# EAGLE design mem3 (EAGLE 4.13)
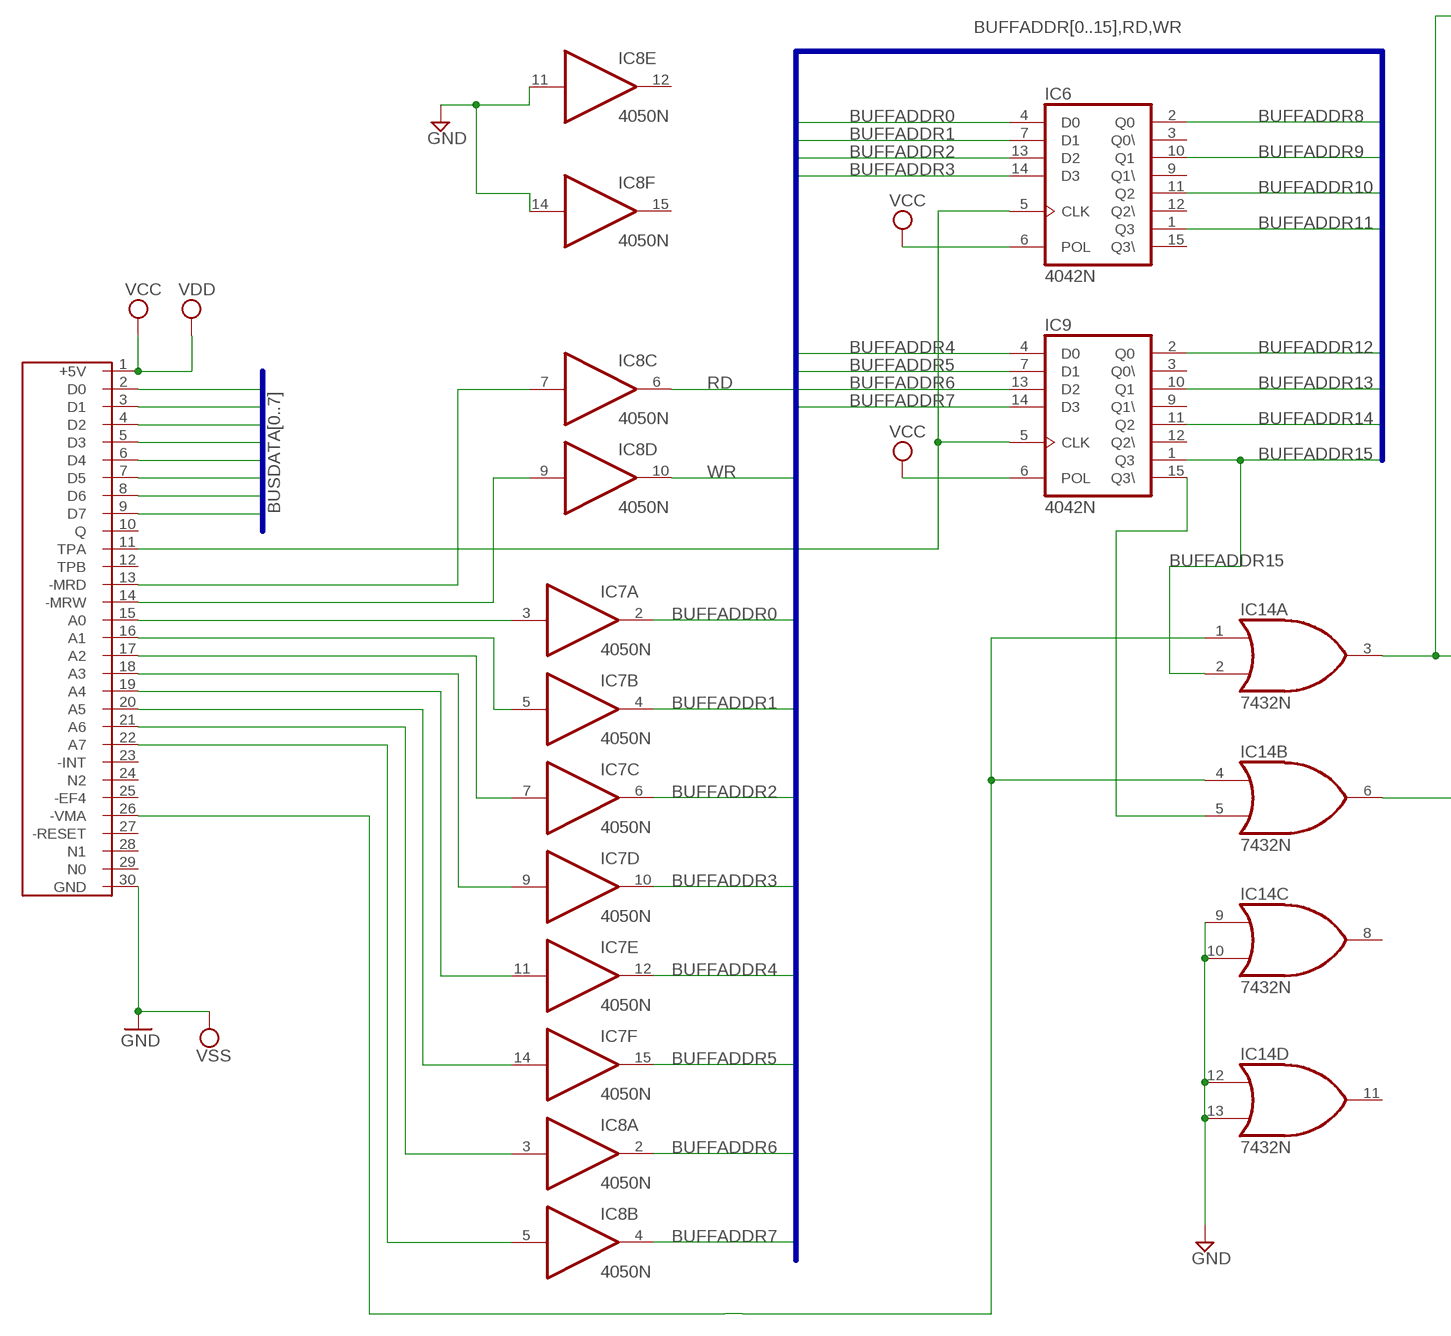
[diagram p0: schematic, sheet 1, part 1 of 2]
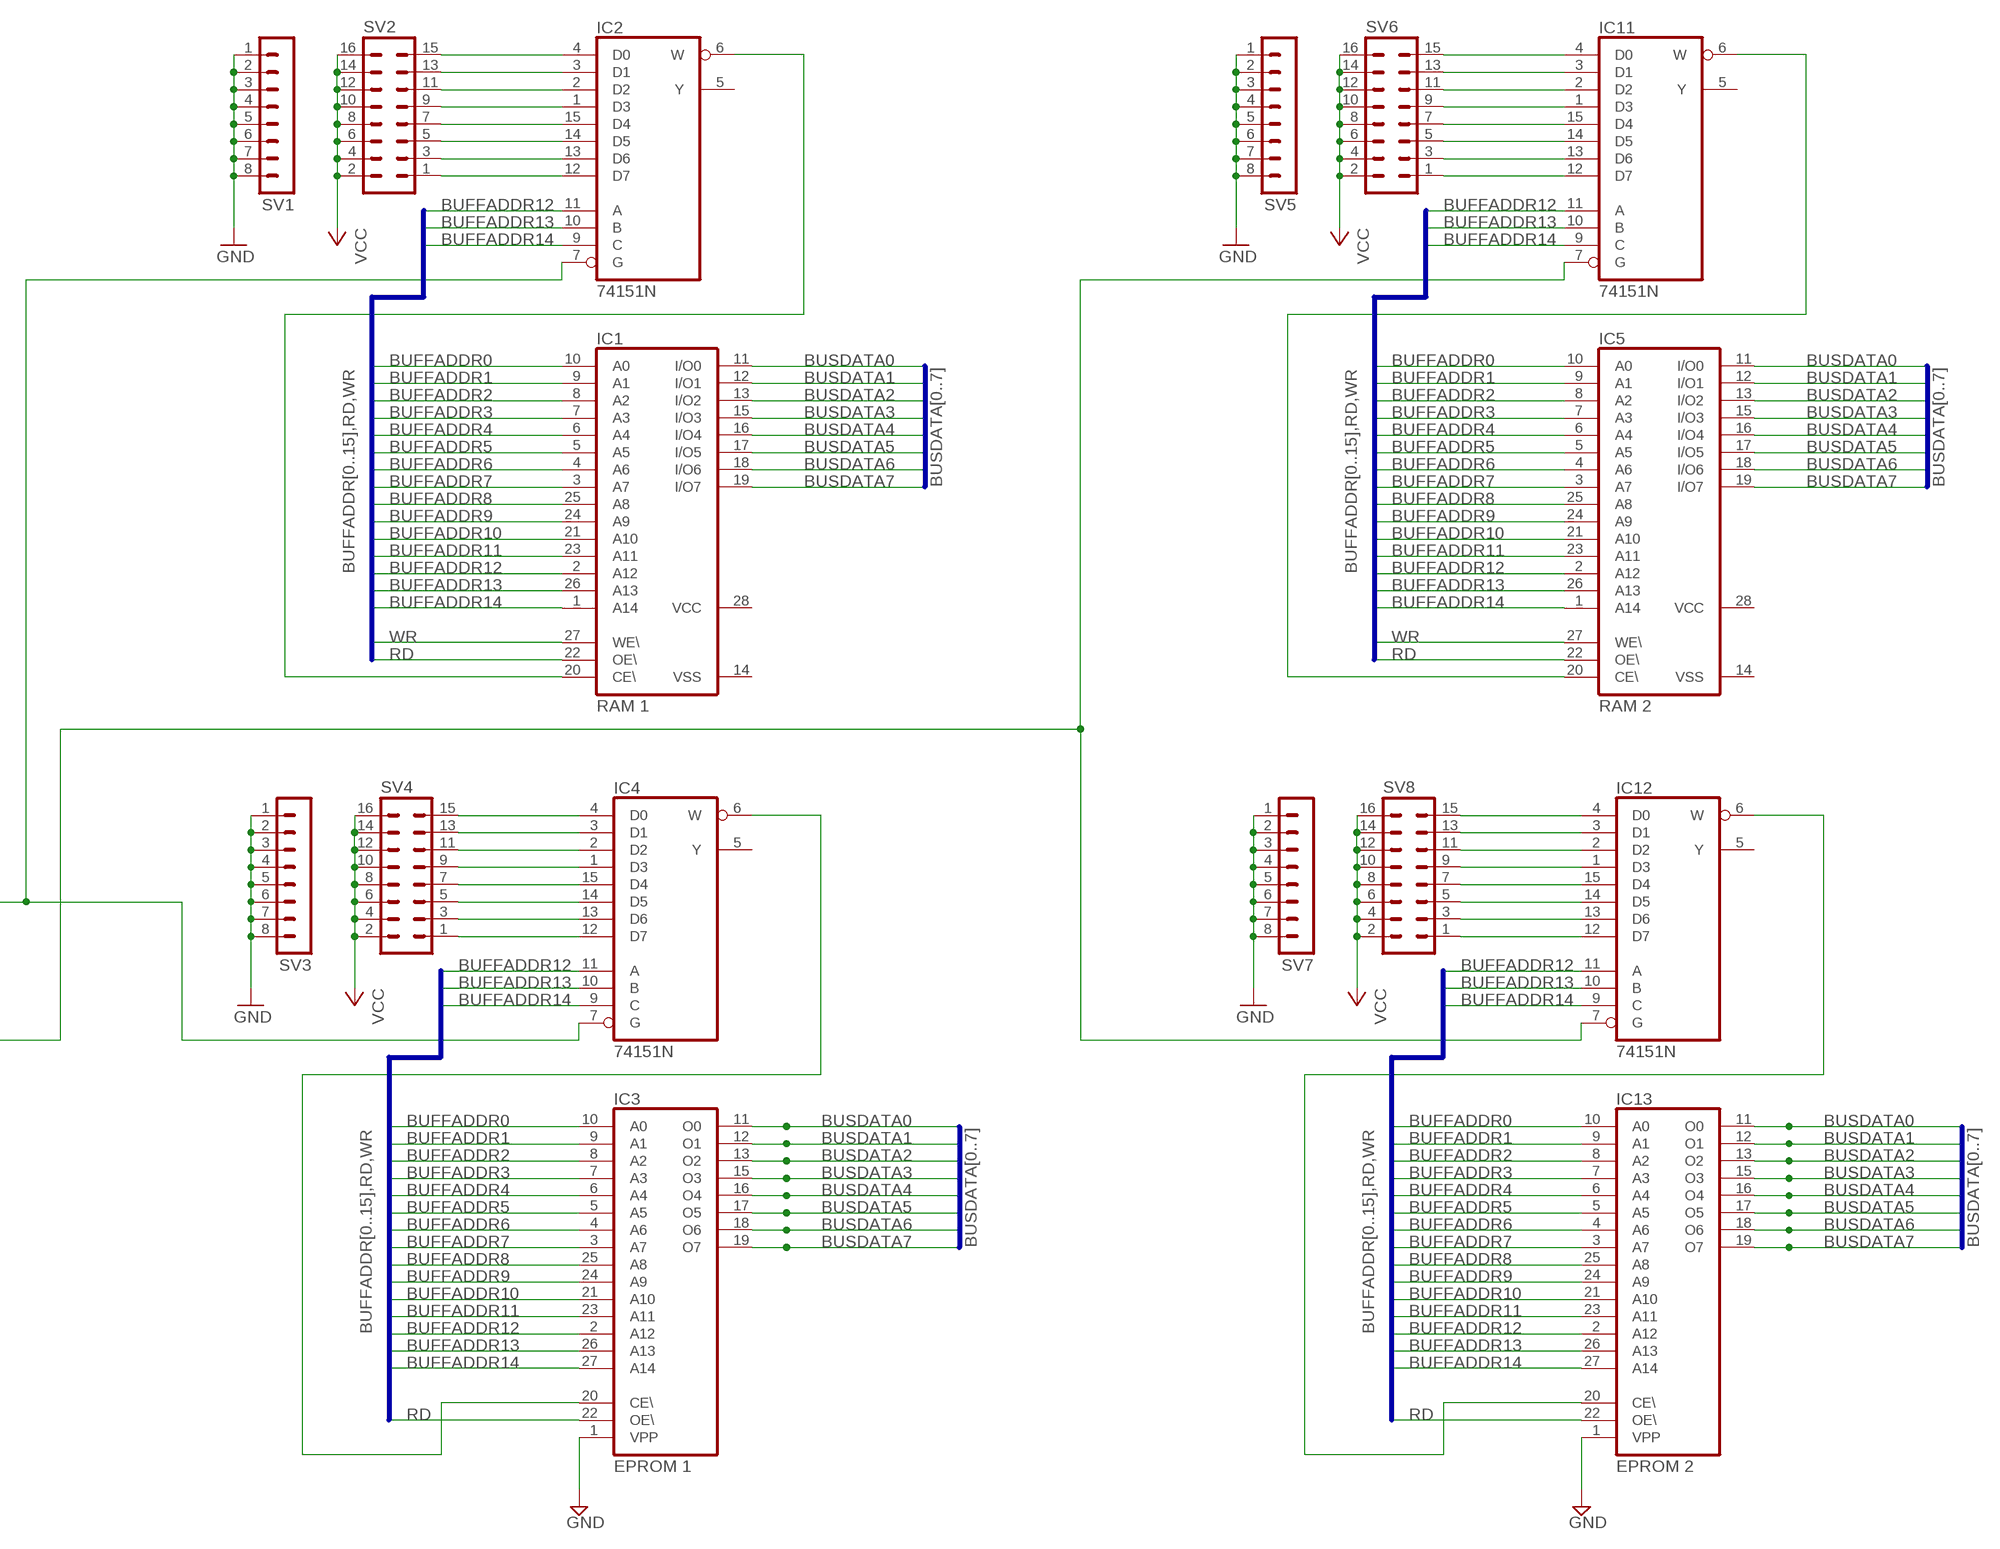
[diagram p1: schematic, sheet 1, part 2 of 2]

## Parts
IC1  RAM 1  58C256P  [DIL28-6]
IC2  74151N  [DIL16]
IC3  EPROM 1  27256  [DIL28]
IC4  74151N  [DIL16]
IC5  RAM 2  58C256P  [DIL28-6]
IC6  4042N  [DIL16]
IC7  4050N  [DIL16]
IC8  4050N  [DIL16]
IC9  4042N  [DIL16]
IC11  74151N  [DIL16]
IC12  74151N  [DIL16]
IC13  EPROM 2  27256  [DIL28]
IC14  7432N  [DIL14]
SV1  MA08-1  [MA08-1]
SV2  MA08-2  [MA08-2]
SV3  MA08-1  [MA08-1]
SV4  MA08-2  [MA08-2]
SV5  MA08-1  [MA08-1]
SV6  MA08-2  [MA08-2]
SV7  MA08-1  [MA08-1]
SV8  MA08-2  [MA08-2]
U$1  C30  [C30]

## Nets
BUFFADDR0: IC1.10(A0) IC3.10(A0) IC5.10(A0) IC6.4(D0) IC7.2(A:O) IC13.10(A0)
BUFFADDR1: IC1.9(A1) IC3.9(A1) IC5.9(A1) IC6.7(D1) IC7.4(B:O) IC13.9(A1)
BUFFADDR2: IC1.8(A2) IC3.8(A2) IC5.8(A2) IC6.13(D2) IC7.6(C:O) IC13.8(A2)
BUFFADDR3: IC1.7(A3) IC3.7(A3) IC5.7(A3) IC6.14(D3) IC7.10(D:O) IC13.7(A3)
BUFFADDR4: IC1.6(A4) IC3.6(A4) IC5.6(A4) IC7.12(E:O) IC9.4(D0) IC13.6(A4)
BUFFADDR5: IC1.5(A5) IC3.5(A5) IC5.5(A5) IC7.15(F:O) IC9.7(D1) IC13.5(A5)
BUFFADDR6: IC1.4(A6) IC3.4(A6) IC5.4(A6) IC8.2(A:O) IC9.13(D2) IC13.4(A6)
BUFFADDR7: IC1.3(A7) IC3.3(A7) IC5.3(A7) IC8.4(B:O) IC9.14(D3) IC13.3(A7)
BUFFADDR8: IC1.25(A8) IC3.25(A8) IC5.25(A8) IC6.2(Q0) IC13.25(A8)
BUFFADDR9: IC1.24(A9) IC3.24(A9) IC5.24(A9) IC6.10(Q1) IC13.24(A9)
BUFFADDR10: IC1.21(A10) IC3.21(A10) IC5.21(A10) IC6.11(Q2) IC13.21(A10)
BUFFADDR11: IC1.23(A11) IC3.23(A11) IC5.23(A11) IC6.1(Q3) IC13.23(A11)
BUFFADDR12: IC1.2(A12) IC2.11(A) IC3.2(A12) IC4.11(A) IC5.2(A12) IC9.2(Q0) IC11.11(A) IC12.11(A) IC13.2(A12)
BUFFADDR13: IC1.26(A13) IC2.10(B) IC3.26(A13) IC4.10(B) IC5.26(A13) IC9.10(Q1) IC11.10(B) IC12.10(B) IC13.26(A13)
BUFFADDR14: IC1.1(A14) IC2.9(C) IC3.27(A14) IC4.9(C) IC5.1(A14) IC9.11(Q2) IC11.9(C) IC12.9(C) IC13.27(A14)
BUFFADDR15: IC9.1(Q3) IC14.2(A:I1)
BUSDATA0: IC1.11(I/O0) IC3.11(O0) IC5.11(I/O0) IC13.11(O0) U$1.2(D0)
BUSDATA1: IC1.12(I/O1) IC3.12(O1) IC5.12(I/O1) IC13.12(O1) U$1.3(D1)
BUSDATA2: IC1.13(I/O2) IC3.13(O2) IC5.13(I/O2) IC13.13(O2) U$1.4(D2)
BUSDATA3: IC1.15(I/O3) IC3.15(O3) IC5.15(I/O3) IC13.15(O3) U$1.5(D3)
BUSDATA4: IC1.16(I/O4) IC3.16(O4) IC5.16(I/O4) IC13.16(O4) U$1.6(D4)
BUSDATA5: IC1.17(I/O5) IC3.17(O5) IC5.17(I/O5) IC13.17(O5) U$1.7(D5)
BUSDATA6: IC1.18(I/O6) IC3.18(O6) IC5.18(I/O6) IC13.18(O6) U$1.8(D6)
BUSDATA7: IC1.19(I/O7) IC3.19(O7) IC5.19(I/O7) IC13.19(O7) U$1.9(D7)
GND: IC3.1(VPP) IC8.11(E:I) IC8.14(F:I) IC13.1(VPP) IC14.9(C:I0) IC14.10(C:I1) IC14.12(D:I0) IC14.13(D:I1) SV1.1 SV1.2 SV1.3 SV1.4 SV1.5 SV1.6 SV1.7 SV1.8 SV3.1 SV3.2 SV3.3 SV3.4 SV3.5 SV3.6 SV3.7 SV3.8 SV5.1 SV5.2 SV5.3 SV5.4 SV5.5 SV5.6 SV5.7 SV5.8 SV7.1 SV7.2 SV7.3 SV7.4 SV7.5 SV7.6 SV7.7 SV7.8 U$1.30(GND) ; supply symbol labelled VSS
N$1: IC1.20(CE\) IC2.6(W)
N$2: IC2.12(D7) SV2.1
N$3: IC2.13(D6) SV2.3
N$4: IC2.14(D5) SV2.5
N$5: IC6.5(CLK) IC9.5(CLK) U$1.11(TPA)
N$6: IC2.15(D4) SV2.7
N$7: IC7.3(A:I) U$1.15(A0)
N$8: IC7.5(B:I) U$1.16(A1)
N$9: IC7.7(C:I) U$1.17(A2)
N$10: IC7.9(D:I) U$1.18(A3)
N$11: IC7.11(E:I) U$1.19(A4)
N$12: IC7.14(F:I) U$1.20(A5)
N$13: IC8.3(A:I) U$1.21(A6)
N$14: IC8.5(B:I) U$1.22(A7)
N$15: IC2.1(D3) SV2.9
N$16: IC2.2(D2) SV2.11
N$17: IC2.3(D1) SV2.13
N$18: IC2.4(D0) SV2.15
N$19: IC3.20(CE\) IC4.6(W)
N$20: IC4.12(D7) SV4.1
N$21: IC4.13(D6) SV4.3
N$22: IC4.14(D5) SV4.5
N$23: IC4.15(D4) SV4.7
N$24: IC4.1(D3) SV4.9
N$25: IC8.9(D:I) U$1.14(-MRW)
N$26: IC8.7(C:I) U$1.13(-MRD)
N$27: IC14.1(A:I0) IC14.4(B:I0) U$1.26(-VMA)
N$28: IC4.2(D2) SV4.11
N$29: IC4.3(D1) SV4.13
N$30: IC4.4(D0) SV4.15
N$32: IC5.20(CE\) IC11.6(W)
N$33: IC11.12(D7) SV6.1
N$34: IC11.13(D6) SV6.3
N$35: IC11.14(D5) SV6.5
N$36: IC11.15(D4) SV6.7
N$37: IC11.1(D3) SV6.9
N$38: IC11.2(D2) SV6.11
N$39: IC11.3(D1) SV6.13
N$40: IC11.4(D0) SV6.15
N$41: IC12.12(D7) SV8.1
N$42: IC12.13(D6) SV8.3
N$43: IC12.14(D5) SV8.5
N$44: IC12.15(D4) SV8.7
N$45: IC12.1(D3) SV8.9
N$46: IC12.2(D2) SV8.11
N$47: IC12.3(D1) SV8.13
N$48: IC12.4(D0) SV8.15
N$49: IC12.6(W) IC13.20(CE\)
N$50: IC9.15(Q3\) IC14.5(B:I1)
N$52: IC2.7(G) IC4.7(G) IC14.3(A:O)
N$53: IC11.7(G) IC12.7(G) IC14.6(B:O)
RD: IC1.22(OE\) IC3.22(OE\) IC5.22(OE\) IC8.6(C:O) IC13.22(OE\)
VCC: IC6.6(POL) IC9.6(POL) SV2.2 SV2.4 SV2.6 SV2.8 SV2.10 SV2.12 SV2.14 SV2.16 SV4.2 SV4.4 SV4.6 SV4.8 SV4.10 SV4.12 SV4.14 SV4.16 SV6.2 SV6.4 SV6.6 SV6.8 SV6.10 SV6.12 SV6.14 SV6.16 SV8.2 SV8.4 SV8.6 SV8.8 SV8.10 SV8.12 SV8.14 SV8.16 U$1.1(+5V) ; supply symbol labelled VDD
WR: IC1.27(WE\) IC5.27(WE\) IC8.10(D:O)
Unconnected: IC2.5(Y) IC4.5(Y) IC6.3(Q0\) IC6.9(Q1\) IC6.12(Q2\) IC6.15(Q3\) IC8.12(E:O) IC8.15(F:O) IC9.3(Q0\) IC9.9(Q1\) IC9.12(Q2\) IC11.5(Y) IC12.5(Y) IC14.8(C:O) IC14.11(D:O) U$1.10(Q) U$1.12(TPB) U$1.23(-INT) U$1.24(N2) U$1.25(-EF4) U$1.27(-RESET) U$1.28(N1) U$1.29(N0)

## Buses
BUFFADDR[0..15],RD,WR
BUSDATA[0..7]

## Power pins joined to a net without a drawn wire
GND: IC1.14(VSS) IC2.8(GND) IC3.14(GND) IC4.8(GND) IC5.14(VSS) IC6.8(VSS) IC7.8(P:VSS) IC8.8(P:VSS) IC9.8(VSS) IC11.8(GND) IC12.8(GND) IC13.14(GND) IC14.7(P:GND)
VCC: IC1.28(VCC) IC2.16(VCC) IC3.28(VCC) IC4.16(VCC) IC5.28(VCC) IC6.16(VDD) IC7.1(P:VDD) IC8.1(P:VDD) IC9.16(VDD) IC11.16(VCC) IC12.16(VCC) IC13.28(VCC) IC14.14(P:VCC)

## Library data of the parts
IC1 IC5 = memory-hitachi:58C256P: MEMORY
IC2 IC4 IC11 IC12 = 74xx-us:74*151: Data SELECTOR/MULTIPLEXER
IC3 IC13 = memory:27256: MEMORY
IC6 IC9 = 40xx:4042: Quad clocked D LATCH
IC7 IC8 = 40xx:4050: Hex non-inverting BUFFER
IC14 = 74xx-us:74*32: Quad 2-input OR gate
SV1 SV3 SV5 SV7 = con-lstb:MA08-1: PIN HEADER
SV2 SV4 SV6 SV8 = con-lstb:MA08-2: PIN HEADER
U$1 = k1:C30

## Board
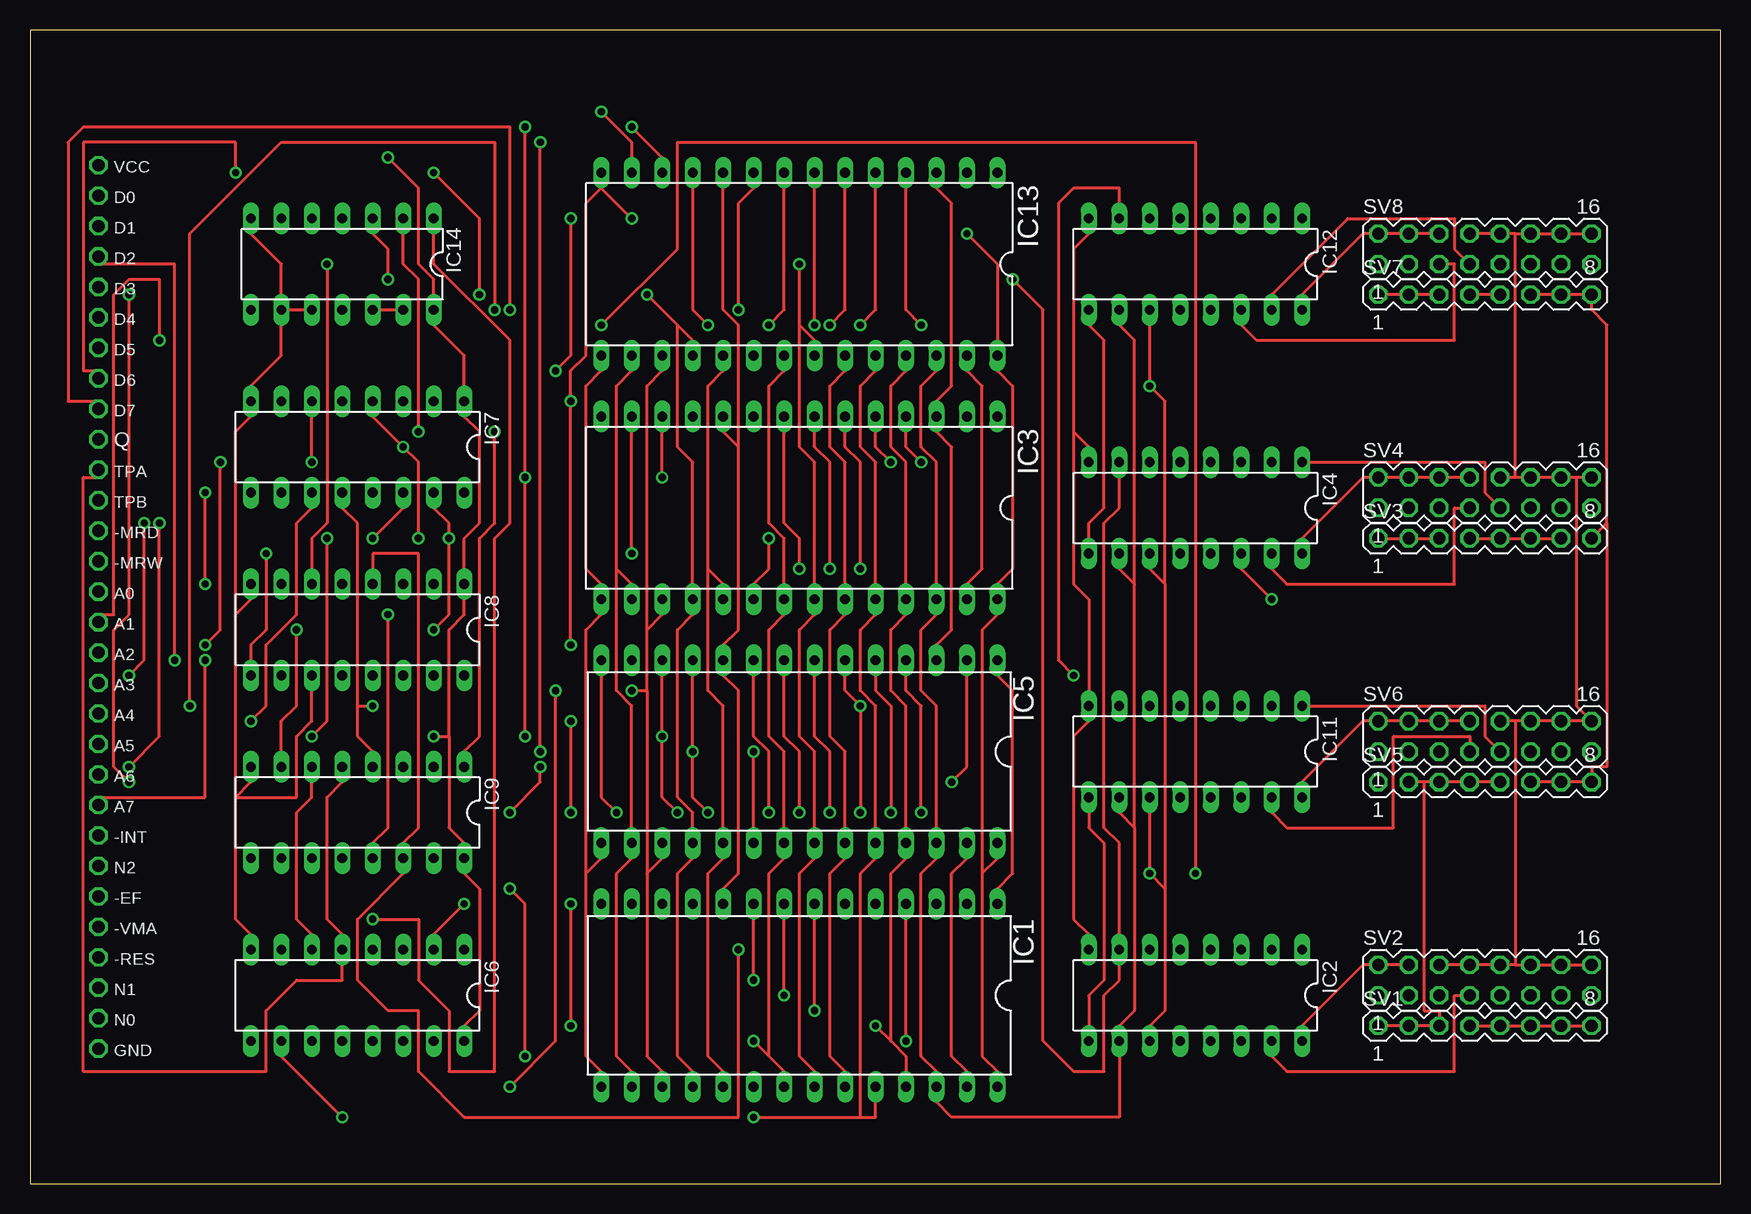
[diagram p2: board, top side]
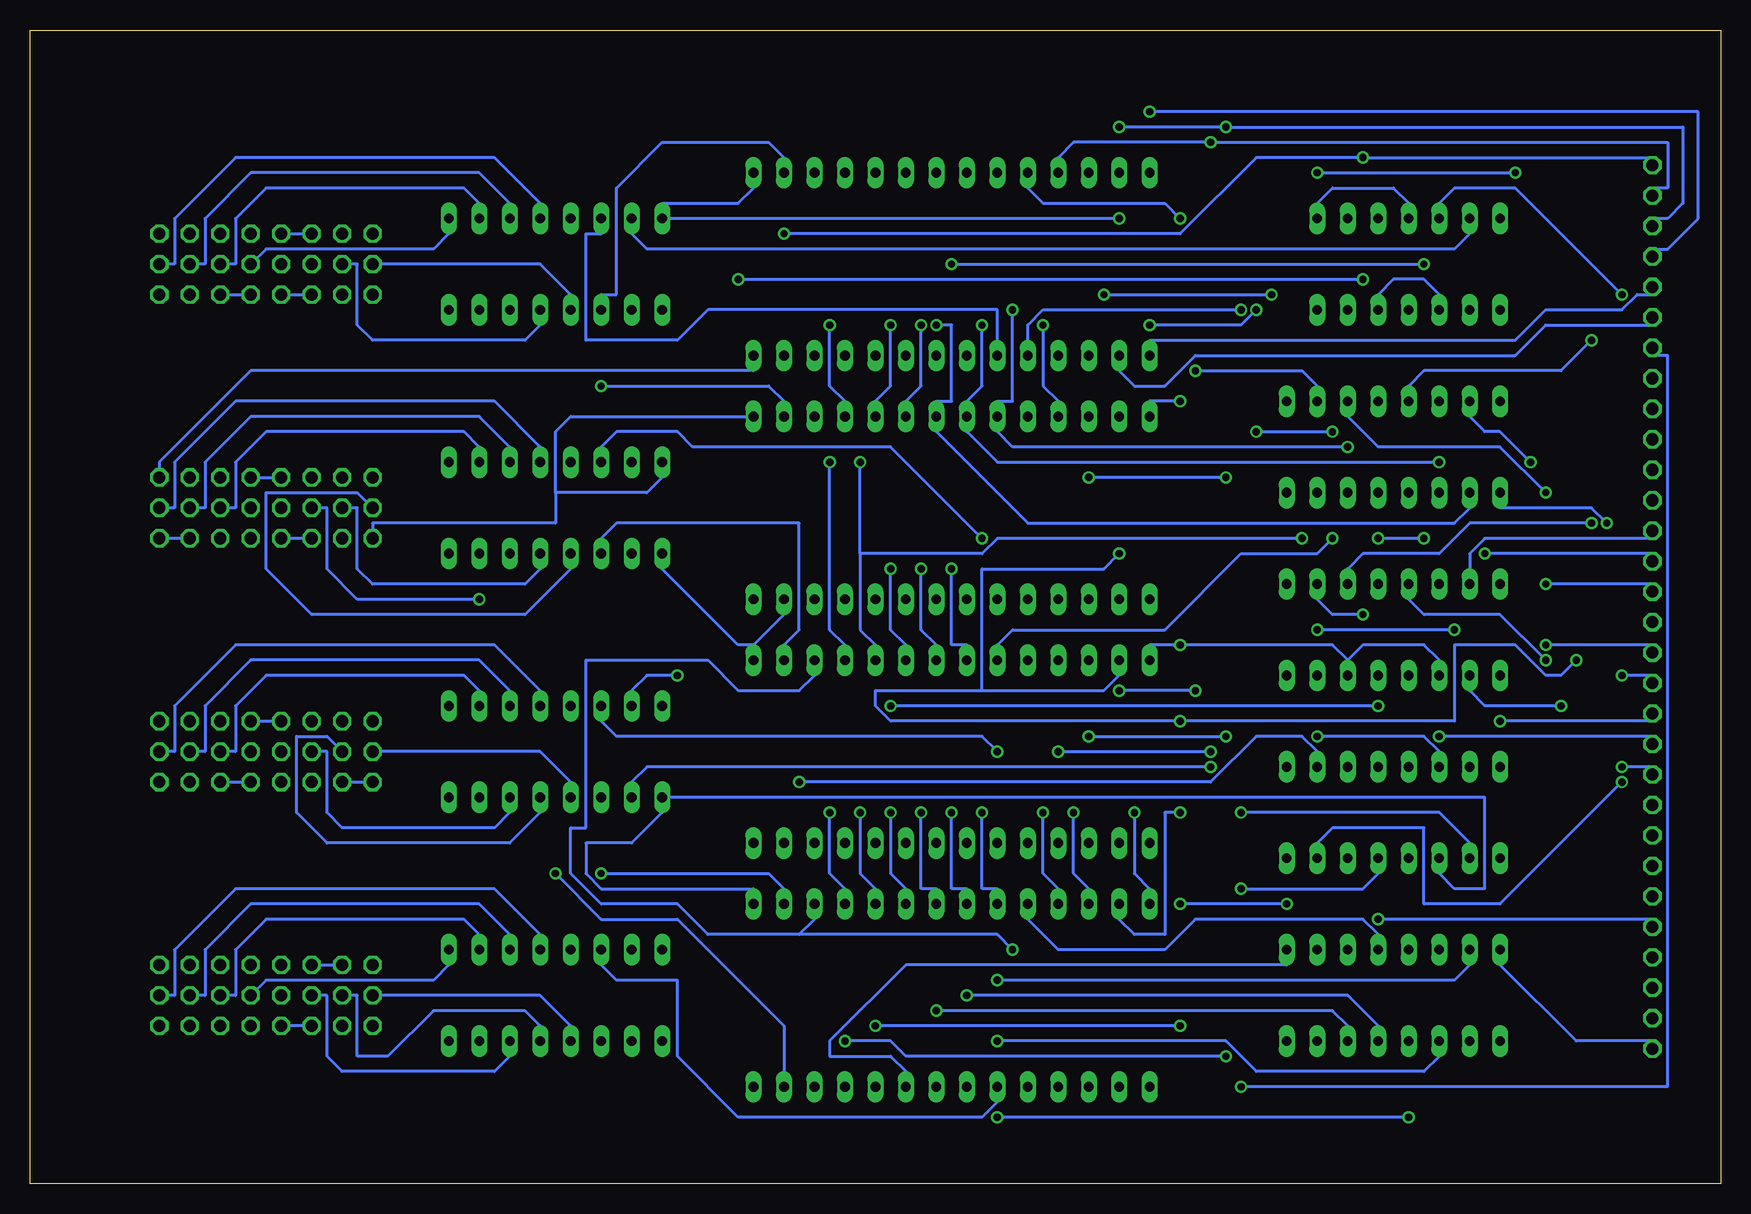
[diagram p3: board, bottom side, seen from below]

Size 140.95 x 96.19 mm. Coordinates in mm from the lower left corner, seen from the top.
Outline: 0,0 140.95,0 140.95,96.19 0,96.19 0,0
Copper layers (1*16): Top 0.035mm / dielectric 1.5mm / Bottom 0.035mm
Design rules "default": minimum track width 10mil, minimum drill 24mil, track to track 8mil, track to pad 8mil, pad to pad 8mil, via to via 8mil, smd to smd 8mil, copper to edge 40mil, drill to drill 8mil, minimum pad ring 10mil, minimum via ring 8mil, stop-mask expansion 4mil, vias tented up to drill 0mil, thermal gap 10mil
tRestrict: area 0.6,0.5 to 75.6,4.3; area 0.6,91.9 to 76.8,95.7
bRestrict: area 0.6,91.9 to 76.8,95.7; area 0.6,0.5 to 75.6,4.3

### Footprints (pad centres in the part's own frame; a part is rotated, then mirrored left to right if it is on the bottom)
DIL28-6 = drill 0.813 long: 1 -16.51,-7.62; 2 -13.97,-7.62; 3 -11.43,-7.62; 4 -8.89,-7.62; 5 -6.35,-7.62; 6 -3.81,-7.62; 7 -1.27,-7.62; 8 1.27,-7.62; 9 3.81,-7.62; 10 6.35,-7.62; 11 8.89,-7.62; 12 11.43,-7.62; 13 13.97,-7.62; 14 16.51,-7.62; 15 16.51,7.62; 16 13.97,7.62; 17 11.43,7.62; 18 8.89,7.62; 19 6.35,7.62; 20 3.81,7.62; 21 1.27,7.62; 22 -1.27,7.62; 23 -3.81,7.62; 24 -6.35,7.62; 25 -8.89,7.62; 26 -11.43,7.62; 27 -13.97,7.62; 28 -16.51,7.62
DIL16 = drill 0.813 long: 1 -8.89,-3.81; 2 -6.35,-3.81; 3 -3.81,-3.81; 4 -1.27,-3.81; 5 1.27,-3.81; 6 3.81,-3.81; 7 6.35,-3.81; 8 8.89,-3.81; 9 8.89,3.81; 10 6.35,3.81; 11 3.81,3.81; 12 1.27,3.81; 13 -1.27,3.81; 14 -3.81,3.81; 15 -6.35,3.81; 16 -8.89,3.81
DIL28 = drill 0.813 long: 1 -16.51,-7.62; 2 -13.97,-7.62; 3 -11.43,-7.62; 4 -8.89,-7.62; 5 -6.35,-7.62; 6 -3.81,-7.62; 7 -1.27,-7.62; 8 1.27,-7.62; 9 3.81,-7.62; 10 6.35,-7.62; 11 8.89,-7.62; 12 11.43,-7.62; 13 13.97,-7.62; 14 16.51,-7.62; 15 16.51,7.62; 16 13.97,7.62; 17 11.43,7.62; 18 8.89,7.62; 19 6.35,7.62; 20 3.81,7.62; 21 1.27,7.62; 22 -1.27,7.62; 23 -3.81,7.62; 24 -6.35,7.62; 25 -8.89,7.62; 26 -11.43,7.62; 27 -13.97,7.62; 28 -16.51,7.62
DIL14 = drill 0.813 long: 1 -7.62,-3.81; 2 -5.08,-3.81; 3 -2.54,-3.81; 4 0,-3.81; 5 2.54,-3.81; 6 5.08,-3.81; 7 7.62,-3.81; 8 7.62,3.81; 9 5.08,3.81; 10 2.54,3.81; 11 0,3.81; 12 -2.54,3.81; 13 -5.08,3.81; 14 -7.62,3.81
MA08-1 = drill 1.016 octagon: 1 -8.89,0; 2 -6.35,0; 3 -3.81,0; 4 -1.27,0; 5 1.27,0; 6 3.81,0; 7 6.35,0; 8 8.89,0
MA08-2 = drill 1.016 octagon: 1 -8.89,-1.27; 2 -8.89,1.27; 3 -6.35,-1.27; 4 -6.35,1.27; 5 -3.81,-1.27; 6 -3.81,1.27; 7 -1.27,-1.27; 8 -1.27,1.27; 9 1.27,-1.27; 10 1.27,1.27; 11 3.81,-1.27; 12 3.81,1.27; 13 6.35,-1.27; 14 6.35,1.27; 15 8.89,-1.27; 16 8.89,1.27
C30 = drill 1.016 octagon: 1 -36.83,0; 2 -34.29,0; 3 -31.75,0; 4 -29.21,0; 5 -26.67,0; 6 -24.13,0; 7 -21.59,0; 8 -19.05,0; 9 -16.51,0; 10 -13.97,0; 11 -11.43,0; 12 -8.89,0; 13 -6.35,0; 14 -3.81,0; 15 -1.27,0; 16 1.27,0; 17 3.81,0; 18 6.35,0; 19 8.89,0; 20 11.43,0; 21 13.97,0; 22 16.51,0; 23 19.05,0; 24 21.59,0; 25 24.13,0; 26 26.67,0; 27 29.21,0; 28 31.75,0; 29 34.29,0; 30 36.83,0

### Placement (x,y rotation side)
IC1  64.13,15.71 180 top
IC2  97.15,15.71 180 top
IC3  64.13,56.35 180 top
IC4  97.15,56.35 180 top
IC5  64.13,36.03 180 top
IC6  27.3,15.71 180 top
IC7  27.3,61.43 180 top
IC8  27.3,46.19 180 top
IC9  27.3,30.95 180 top
IC11  97.15,36.03 180 top
IC12  97.15,76.67 180 top
IC13  64.13,76.67 180 top
IC14  26.03,76.67 180 top
SV1  121.28,13.17 0 top
SV2  121.28,16.98 0 top
SV3  121.28,53.81 0 top
SV4  121.28,57.62 0 top
SV5  121.28,33.49 0 top
SV6  121.28,37.3 0 top
SV7  121.28,74.13 0 top
SV8  121.28,77.94 0 top
U$1  5.71,48.09 270 top

### Tracks (layer width: path | path; a pad name or v marks a point on that pad's centre or on a via)
BUFFADDR0  (via drill 0.61)
  Top 0.254: v43.81,67.78 45.08,69.05 v45.08,80.48 | 59.05,61.43 59.05,46.19 57.78,44.92 IC5.10 57.78,42.38 59.05,41.11 59.05,25.87 57.78,24.6 IC1.10 | 59.05,61.43 57.78,62.7 IC3.10 | 59.05,61.43 59.05,71.59 57.78,72.86 IC13.10
  Bottom 0.254: v43.81,67.78 34.92,67.78 33.65,66.51 IC7.2 | v45.08,80.48 46.35,81.75 56.51,81.75 57.78,83.02 IC13.10 | IC6.4 28.57,20.79 29.84,22.06 43.81,22.06 46.35,19.52 55.24,19.52 57.78,22.06 IC1.10
BUFFADDR1  (via drill 0.61)
  Top 0.254: IC7.4 28.57,63.97 v31.11,61.43 32.38,60.16 v32.38,53.81 | v59.05,72.86 59.05,81.75 60.32,83.02 IC13.9 | v60.32,16.98 IC1.9 | v61.59,30.95 61.59,36.03 60.32,37.3 IC5.9
  Bottom 0.254: v31.11,61.43 59.05,61.43 60.32,62.7 IC3.9 60.32,65.24 59.05,65.24 v59.05,72.86 | v60.32,16.98 22.22,16.98 20.95,18.25 IC6.7 | v61.59,30.95 61.59,24.6 60.32,24.6 IC1.9 | v32.38,53.81 33.65,52.54 40,52.54 46.35,46.19 59.05,46.19 60.32,44.92 IC5.9
BUFFADDR2  (via drill 0.61)
  Top 0.254: v61.59,71.59 62.86,72.86 IC13.8 | v23.49,60.16 IC7.6 | v62.86,15.71 IC1.8 | v64.13,30.95 64.13,36.03 62.86,37.3 IC5.8 | v64.13,51.27 64.13,53.81 62.86,55.08 IC3.8
  Bottom 0.254: v61.59,71.59 61.59,66.51 62.86,65.24 IC3.8 62.86,62.7 60.32,60.16 v23.49,60.16 | v62.86,15.71 31.11,15.71 28.57,13.17 IC6.13 | v64.13,30.95 64.13,24.6 62.86,24.6 IC1.8 | v64.13,51.27 64.13,44.92 62.86,44.92 IC5.8
BUFFADDR3  (via drill 0.61)
  Top 0.254: v65.4,14.44 IC1.7 | v66.67,30.95 66.67,36.03 65.4,37.3 IC5.7 | v65.4,71.59 IC13.7 | v66.67,51.27 66.67,60.16 65.4,61.43 IC3.7
  Bottom 0.254: v65.4,14.44 32.38,14.44 31.11,13.17 IC6.14 | v66.67,30.95 66.67,24.6 65.4,24.6 IC1.7 | IC7.10 20.95,56.35 22.22,55.08 57.78,55.08 65.4,62.7 IC3.7 65.4,65.24 64.13,65.24 64.13,71.59 v65.4,71.59 | v66.67,51.27 66.67,46.19 65.4,44.92 IC5.7
BUFFADDR4  (via drill 0.61)
  Top 0.254: 27.3,39.84 27.3,55.08 26.03,56.35 IC7.12 | 27.3,39.84 27.3,37.3 28.57,36.03 IC9.4 | v69.21,30.95 v69.21,39.84 67.94,41.11 IC5.6 | v66.67,71.59 67.94,72.86 IC13.6 | v69.21,51.27 69.21,60.16 67.94,61.43 IC3.6 | 27.3,39.84 v28.57,39.84
  Bottom 0.254: v69.21,30.95 69.21,25.87 67.94,24.6 IC1.6 | v66.67,71.59 66.67,66.51 67.94,65.24 IC3.6 | v69.21,51.27 69.21,46.19 67.94,44.92 IC5.6 | v28.57,39.84 v69.21,39.84
BUFFADDR5  (via drill 0.61)
  Top 0.254: v22.22,46.19 22.22,39.84 20.95,38.57 IC9.7 | v33.65,46.19 34.92,47.46 v34.92,53.81 34.92,55.08 33.65,56.35 IC7.15 | v71.75,30.95 71.75,39.84 70.48,41.11 IC5.5 | v69.21,71.59 70.48,72.86 IC13.5 | v71.75,60.16 70.48,61.43 IC3.5
  Bottom 0.254: v22.22,46.19 v33.65,46.19 | v71.75,30.95 71.75,25.87 70.48,24.6 IC1.5 | v69.21,71.59 69.21,66.51 70.48,65.24 IC3.5 | 71.75,52.54 v71.75,60.16 | 71.75,52.54 71.75,46.19 70.48,44.92 IC5.5 | v34.92,53.81 60.32,53.81 61.59,52.54 71.75,52.54
BUFFADDR6  (via drill 0.61)
  Top 0.254: v29.84,47.46 29.84,29.68 28.57,28.41 IC9.13 | v74.29,30.95 74.29,39.84 73.02,41.11 IC5.4 | v74.29,71.59 73.02,72.86 IC13.4 | v74.29,60.16 73.02,61.43 IC3.4 | v40,24.6 41.27,23.33 v41.27,10.63 | v73.02,11.9 IC1.4
  Bottom 0.254: v29.84,47.46 32.38,47.46 33.65,48.73 IC8.2 | v74.29,30.95 74.29,25.87 73.02,24.6 IC1.4 | v74.29,71.59 74.29,66.51 73.02,65.24 IC3.4 | v74.29,60.16 74.29,46.19 73.02,44.92 IC5.4 | v40,24.6 29.84,24.6 28.57,25.87 IC9.13 | v41.27,10.63 67.94,10.63 69.21,11.9 v73.02,11.9
BUFFADDR7  (via drill 0.61)
  Top 0.254: IC8.4 28.57,52.54 32.38,52.54 32.38,29.68 31.11,28.41 IC9.14 31.11,25.87 27.3,22.06 27.3,16.98 29.84,14.44 32.38,14.44 32.38,9.36 36.19,5.55 59.05,5.55 v59.05,19.52 | IC13.3 75.56,83.02 76.83,81.75 76.83,66.51 75.56,65.24 IC3.3 75.56,62.7 76.83,61.43 76.83,46.19 75.56,44.92 IC5.3
  Bottom 0.254: 76.83,20.79 75.56,22.06 IC1.3 | 76.83,20.79 84.45,20.79 86.99,23.33 93.34,23.33 95.88,25.87 95.88,29.68 94.61,29.68 94.61,43.65 84.45,43.65 81.91,41.11 76.83,41.11 75.56,42.38 IC5.3 | v59.05,19.52 60.32,20.79 76.83,20.79
BUFFADDR8  (via drill 0.61)
  Top 0.254: v36.19,23.33 33.65,20.79 IC6.2 | v45.08,23.33 v45.08,13.17 | 71.75,11.9 73.02,10.63 IC1.25 | v70.48,13.17 71.75,11.9 | 71.75,11.9 71.75,25.87 73.02,27.14 IC5.25 73.02,39.84 71.75,41.11 71.75,46.19 73.02,47.46 IC3.25 73.02,60.16 71.75,61.43 71.75,66.51 73.02,67.78 IC13.25
  Bottom 0.254: v36.19,23.33 v45.08,23.33 | v45.08,13.17 v70.48,13.17
BUFFADDR9  (via drill 0.61)
  Top 0.254: v26.03,5.55 20.95,10.63 IC6.10 | 69.21,5.55 70.48,5.55 IC1.24 | v60.32,5.55 69.21,5.55 | 69.21,5.55 69.21,25.87 70.48,27.14 IC5.24 70.48,39.84 69.21,41.11 69.21,46.19 70.48,47.46 IC3.24 70.48,60.16 69.21,61.43 69.21,66.51 70.48,67.78 IC13.24
  Bottom 0.254: v26.03,5.55 v60.32,5.55
BUFFADDR10  (via drill 0.61)
  Top 0.254: 61.59,10.63 62.86,9.36 IC1.21 | v60.32,11.9 61.59,10.63 | 61.59,10.63 61.59,25.87 62.86,27.14 IC5.21 62.86,36.03 61.59,37.3 61.59,46.19 62.86,47.46 IC3.21 62.86,53.81 61.59,55.08 61.59,66.51 62.86,67.78 IC13.21
  Bottom 0.254: v60.32,11.9 41.27,11.9 38.73,9.36 24.76,9.36 23.49,10.63 IC6.11
BUFFADDR11
  Top 0.254: IC1.23 67.94,9.36 66.67,10.63 66.67,25.87 67.94,27.14 IC5.23 67.94,36.03 66.67,37.3 66.67,46.19 67.94,47.46 IC3.23 67.94,60.16 66.67,61.43 66.67,66.51 67.94,67.78 IC13.23
  Bottom 0.254: IC6.1 36.19,18.25 67.94,18.25 74.29,11.9 74.29,10.63 69.21,10.63 67.94,9.36 IC1.23
BUFFADDR12  (via drill 0.61)
  Top 0.254: v76.83,33.49 78.1,34.76 IC5.2 | IC12.11 v93.34,66.51 94.61,65.24 94.61,50 | IC11.11 v93.34,25.87 94.61,24.6 | 94.61,24.6 94.61,14.44 93.34,13.17 IC2.11 | 94.61,50 93.34,51.27 IC4.11 | 94.61,50 94.61,24.6
  Bottom 0.254: v76.83,33.49 42.54,33.49 38.73,37.3 34.92,37.3 33.65,36.03 IC9.2 | v93.34,66.51 79.37,66.51 78.1,65.24 IC3.2 | IC13.2 78.1,85.56 79.37,86.83 88.26,86.83 92.07,83.02 92.07,74.13 93.34,74.13 IC12.11 | v93.34,25.87 79.37,25.87 78.1,24.6 IC1.2 | IC5.2 78.1,44.92 76.83,46.19 76.83,55.08 92.07,55.08 93.34,53.81 IC4.11
BUFFADDR13  (via drill 0.61)
  Top 0.254: IC13.26 75.56,67.78 74.29,66.51 74.29,61.43 75.56,60.16 IC3.26 75.56,47.46 74.29,46.19 74.29,41.11 75.56,39.84 IC5.26 75.56,27.14 74.29,25.87 74.29,10.63 75.56,9.36 IC1.26 75.56,6.82 76.83,5.55 90.8,5.55 IC2.10 90.8,13.17 92.07,14.44 92.07,29.68 | v40,30.95 42.54,33.49 v42.54,34.76 | 92.07,29.68 90.8,30.95 IC11.10 | 92.07,50 90.8,51.27 IC4.10 | 92.07,29.68 92.07,50 | 92.07,50 92.07,70.32 90.8,71.59 IC12.10
  Bottom 0.254: v40,30.95 23.49,30.95 20.95,28.41 IC9.10 | v42.54,34.76 89.53,34.76 90.8,33.49 IC11.10
BUFFADDR14
  Top 0.254: IC1.1 80.64,24.6 81.91,25.87 81.91,41.11 80.64,42.38 IC5.1 | IC13.27 78.1,67.78 79.37,66.51 79.37,51.27 78.1,50 IC3.27 | IC12.9 88.26,71.59 89.53,70.32 89.53,56.35 88.26,55.08 IC4.9 | IC2.9 88.26,15.71 89.53,16.98 89.53,28.41 88.26,29.68 IC11.9
  Bottom 0.254: 80.64,44.92 78.1,47.46 IC3.27 | 80.64,44.92 81.91,44.92 88.26,51.27 IC4.9 | IC5.1 80.64,44.92 | IC9.11 23.49,25.87 22.22,24.6 19.68,24.6 19.68,32.22 IC11.9 88.26,30.95 90.8,28.41 94.61,28.41 94.61,25.87 93.34,24.6 80.64,24.6 IC1.1
BUFFADDR15  (via drill 0.61)
  Top 0.254: v38.73,62.7 38.73,55.08 37.46,53.81 37.46,37.3 36.19,36.03 IC9.1 | v32.38,62.7 32.38,75.4 31.11,76.67 IC14.2
  Bottom 0.254: v38.73,62.7 v32.38,62.7
BUSDATA0  (via drill 0.61)
  Top 0.254: v56.51,30.95 55.24,32.22 v55.24,36.03 IC5.11 | v56.51,71.59 55.24,72.86 IC13.11 | v42.54,36.03 v42.54,86.83
  Bottom 0.254: v56.51,30.95 56.51,25.87 55.24,24.6 IC1.11 | U$1.2 5.71,83.02 4.44,83.02 4.44,86.83 v42.54,86.83 53.97,86.83 55.24,85.56 IC13.11 | v56.51,71.59 56.51,66.51 55.24,65.24 IC3.11 | v55.24,36.03 v42.54,36.03
BUSDATA1  (via drill 0.61)
  Top 0.254: v53.97,30.95 52.7,32.22 v52.7,37.3 IC5.12 | v50.16,88.1 52.7,85.56 IC13.12 | v41.27,88.1 v41.27,58.89 v41.27,37.3 | v52.7,58.89 IC3.12
  Bottom 0.254: v53.97,30.95 53.97,25.87 52.7,24.6 IC1.12 | v50.16,88.1 v41.27,88.1 3.17,88.1 3.17,81.75 4.44,80.48 5.71,80.48 U$1.3 | v41.27,58.89 v52.7,58.89 | v52.7,37.3 v41.27,37.3
BUSDATA2  (via drill 0.61)
  Top 0.254: v47.62,89.37 50.16,86.83 IC13.13 | v45.08,38.57 v45.08,30.95 | v50.16,52.54 IC3.13 | v12.06,43.65 12.06,76.67 5.71,76.67 U$1.4
  Bottom 0.254: v47.62,89.37 1.9,89.37 1.9,80.48 4.44,77.94 5.71,77.94 U$1.4 | v45.08,30.95 46.35,30.95 46.35,20.79 48.89,20.79 50.16,22.06 IC1.13 | 61.59,41.11 51.43,41.11 50.16,42.38 IC5.13 | 61.59,41.11 70.48,41.11 70.48,39.84 69.21,38.57 v45.08,38.57 22.22,38.57 22.22,44.92 17.14,44.92 14.6,42.38 13.33,42.38 v12.06,43.65 | v50.16,52.54 51.43,51.27 61.59,51.27 61.59,41.11
BUSDATA3
  Top 0.254: 46.35,25.87 46.35,10.63 47.62,9.36 IC1.15 | 46.35,25.87 47.62,27.14 IC5.15 | 46.35,25.87 46.35,46.19 47.62,47.46 IC3.15 47.62,50 46.35,51.27 46.35,66.51 47.62,67.78 IC13.15
  Bottom 0.254: U$1.5 5.71,74.13 6.98,74.13 8.25,72.86 14.6,72.86 17.14,70.32 47.62,70.32 IC13.15
BUSDATA4
  Top 0.254: IC1.16 50.16,9.36 48.89,10.63 48.89,25.87 50.16,27.14 IC5.16 50.16,39.84 48.89,41.11 48.89,51.27 | 48.89,51.27 50.16,50 IC3.16 | 48.89,51.27 48.89,66.51 50.16,67.78 IC13.16
  Bottom 0.254: U$1.6 5.71,71.59 14.6,71.59 17.14,69.05 43.81,69.05 46.35,66.51 48.89,66.51 50.16,67.78 IC13.16
BUSDATA5  (via drill 0.61)
  Top 0.254: 51.43,25.87 51.43,10.63 52.7,9.36 IC1.17 | 51.43,25.87 52.7,27.14 IC5.17 | 51.43,46.19 52.7,47.46 IC3.17 | 51.43,41.11 51.43,25.87 | 51.43,41.11 51.43,46.19 | v40,8.09 43.81,11.9 v43.81,41.11 | v50.16,41.11 51.43,41.11 | 51.43,46.19 51.43,66.51 52.7,67.78 IC13.17
  Bottom 0.254: v40,8.09 4.44,8.09 4.44,69.05 5.71,69.05 U$1.7 | v43.81,41.11 v50.16,41.11
BUSDATA6  (via drill 0.61)
  Top 0.254: IC1.18 55.24,9.36 53.97,10.63 53.97,25.87 55.24,27.14 IC5.18 55.24,30.95 53.97,32.22 53.97,46.19 55.24,47.46 IC3.18 55.24,60.16 53.97,61.43 53.97,71.59 | v17.14,84.29 17.14,86.83 4.44,86.83 4.44,67.78 5.71,67.78 U$1.8 | v33.65,84.29 37.46,80.48 v37.46,74.13 | 53.97,71.59 55.24,70.32 IC13.18 | 53.97,71.59 v51.43,74.13
  Bottom 0.254: v33.65,84.29 v17.14,84.29 | v51.43,74.13 v37.46,74.13
BUSDATA7  (via drill 0.61)
  Top 0.254: IC1.19 57.78,9.36 56.51,10.63 56.51,25.87 57.78,27.14 IC5.19 57.78,39.84 56.51,41.11 56.51,51.27 | v40,72.86 40,88.1 4.44,88.1 3.17,86.83 3.17,65.24 5.71,65.24 U$1.9 | 56.51,51.27 57.78,50 IC3.19 | 56.51,51.27 56.51,66.51 57.78,67.78 IC13.19
  Bottom 0.254: v40,72.86 56.51,72.86 57.78,71.59 IC13.19
GND  (via drill 0.61)
  Top 0.254: 47.62,83.02 46.35,81.75 46.35,69.05 45.08,67.78 v45.08,65.24 v45.08,44.92 | v48.89,30.95 47.62,32.22 IC5.14 | IC14.12 IC14.13 | IC14.9 20.95,69.05 18.41,66.51 IC7.8 18.41,63.97 17.14,62.7 17.14,47.46 | IC14.7 18.41,79.21 20.95,76.67 IC14.9 | IC14.9 IC14.10 | 17.14,32.22 18.41,33.49 IC9.8 | 17.14,32.22 17.14,22.06 18.41,20.79 IC6.8 | 17.14,47.46 18.41,48.73 IC8.8 | 17.14,32.22 17.14,47.46 | 17.14,32.22 22.22,32.22 22.22,37.3 23.49,38.57 IC8.11 | IC2.8 88.26,20.79 86.99,22.06 86.99,37.3 88.26,38.57 IC11.8 88.26,48.73 86.99,50 86.99,62.7 | 86.99,62.7 88.26,61.43 IC4.8 | 86.99,62.7 86.99,77.94 88.26,79.21 IC12.8 | SV1.1 SV1.2 SV1.3 117.47,14.44 116.2,14.44 116.2,33.49 | SV1.4 SV1.5 SV1.6 SV1.7 SV1.8 | SV5.6 SV5.7 SV5.8 130.17,34.76 131.44,34.76 131.44,55.08 | 116.2,33.49 SV5.2 | 116.2,33.49 SV5.3 SV5.4 SV5.5 | SV7.6 SV7.7 SV7.8 130.17,72.86 131.44,71.59 131.44,55.08 | SV7.5 SV7.4 | SV7.1 SV7.2 SV7.3 | SV3.4 SV3.5 SV3.6 SV3.7 | SV3.1 SV3.2 SV3.3 | SV3.8 131.44,55.08 | 47.62,83.02 v50.16,80.48 | 47.62,83.02 IC13.14
  Bottom 0.254: v45.08,65.24 47.62,65.24 IC3.14 | 31.11,43.65 29.84,44.92 24.76,44.92 23.49,43.65 IC8.11 | v48.89,30.95 48.89,25.87 47.62,24.6 IC1.14 | 31.11,43.65 32.38,44.92 v45.08,44.92 47.62,44.92 IC5.14 | 31.11,43.65 IC8.14 | IC14.12 28.57,74.13 27.3,75.4 24.76,75.4 23.49,74.13 IC14.10 | U$1.30 5.71,11.9 12.06,11.9 18.41,18.25 IC6.8 | IC13.1 80.64,83.02 81.91,81.75 88.26,81.75 IC12.8 v50.16,80.48 | SV1.3 SV1.4 | SV5.2 SV5.1 | SV5.6 SV5.5 | SV7.4 SV7.3 | SV7.6 SV7.5 | SV3.7 SV3.8 | IC3.1 95.88,63.97 97.15,62.7 97.15,57.62 | 97.15,57.62 97.15,55.08 112.39,55.08 SV3.1 | SV3.3 SV3.4 | 97.15,57.62 89.53,57.62 88.26,58.89 IC4.8
N$1
  Bottom 0.254: IC1.20 60.32,6.82 61.59,5.55 81.91,5.55 86.99,10.63 86.99,16.98 92.07,16.98 93.34,18.25 IC2.6
N$2
  Bottom 0.254: SV2.1 98.42,15.71 95.88,13.17 IC2.12
N$3
  Bottom 0.254: SV2.3 113.66,15.71 113.66,10.63 111.12,10.63 107.31,14.44 99.69,14.44 98.42,13.17 IC2.13
N$4
  Bottom 0.254: SV2.5 116.2,15.71 116.2,10.63 114.93,9.36 102.23,9.36 100.96,10.63 IC2.14
N$5
  Top 0.254: IC9.5 26.03,33.49 24.76,32.22 24.76,22.06 26.03,20.79 IC6.5 26.03,16.98 22.22,16.98 19.68,14.44 19.68,9.36 4.44,9.36 4.44,58.89 5.71,58.89 U$1.11
N$6
  Top 0.254: SV2.7 118.74,15.71 118.74,9.36 104.77,9.36 103.5,10.63 IC2.15
N$7  (via drill 0.61)
  Top 0.254: v14.6,50 v14.6,57.62
  Bottom 0.254: v14.6,50 5.71,50 U$1.15 | v14.6,57.62 18.41,61.43 28.57,61.43 31.11,63.97 IC7.3
N$8  (via drill 0.61)
  Top 0.254: v10.79,70.32 10.79,75.4 8.25,75.4 6.98,74.13 6.98,47.46 5.71,47.46 U$1.16
  Bottom 0.254: v10.79,70.32 13.33,67.78 24.76,67.78 26.03,66.51 IC7.5
N$9  (via drill 0.61)
  Top 0.254: v14.6,44.92 15.87,46.19 v15.87,60.16
  Bottom 0.254: v14.6,44.92 5.71,44.92 U$1.17 | v15.87,60.16 18.41,62.7 19.68,62.7 20.95,63.97 IC7.7
N$10  (via drill 0.61)
  Top 0.254: v8.25,42.38 9.52,43.65 v9.52,55.08
  Bottom 0.254: v8.25,42.38 5.71,42.38 U$1.18 | v9.52,55.08 10.79,56.35 18.41,56.35 IC7.9
N$11  (via drill 0.61)
  Top 0.254: v18.41,38.57 19.68,39.84 19.68,44.92 22.22,47.46 22.22,55.08 23.49,56.35 IC7.11
  Bottom 0.254: v18.41,38.57 5.71,38.57 U$1.19
N$12  (via drill 0.61)
  Top 0.254: v23.49,37.3 24.76,38.57 v24.76,53.81 | v28.57,53.81 31.11,56.35 IC7.14
  Bottom 0.254: v23.49,37.3 5.71,37.3 U$1.20 | v24.76,53.81 v28.57,53.81
N$13  (via drill 0.61)
  Top 0.254: v8.25,34.76 10.79,37.3 v10.79,55.08
  Bottom 0.254: v8.25,34.76 5.71,34.76 U$1.21 | v10.79,55.08 20.95,55.08 23.49,52.54 29.84,52.54 31.11,51.27 IC8.3
N$14  (via drill 0.61)
  Top 0.254: v14.6,43.65 14.6,32.22 5.71,32.22 U$1.22
  Bottom 0.254: v14.6,43.65 18.41,47.46 24.76,47.46 26.03,48.73 IC8.5
N$15
  Bottom 0.254: SV2.9 121.28,16.98 107.31,16.98 106.04,18.25 IC2.1
N$16
  Bottom 0.254: SV2.11 123.82,15.71 123.82,19.52 121.28,22.06 104.77,22.06 103.5,20.79 IC2.2
N$17
  Bottom 0.254: SV2.13 126.36,15.71 126.36,19.52 122.55,23.33 103.5,23.33 100.96,20.79 IC2.3
N$18
  Bottom 0.254: SV2.15 128.9,15.71 128.9,19.52 123.82,24.6 102.23,24.6 98.42,20.79 IC2.4
N$19  (via drill 0.61)
  Top 0.254: v61.59,53.81 61.59,51.27 60.32,50 IC3.20
  Bottom 0.254: v61.59,53.81 69.21,61.43 85.72,61.43 86.99,62.7 92.07,62.7 93.34,61.43 IC4.6
N$20
  Bottom 0.254: SV4.1 113.66,57.62 121.28,57.62 121.28,51.27 117.47,47.46 99.69,47.46 95.88,51.27 IC4.12
N$21
  Bottom 0.254: SV4.3 113.66,56.35 113.66,51.27 112.39,50 99.69,50 98.42,51.27 IC4.13
N$22  (via drill 0.61)
  Top 0.254: v103.5,48.73 100.96,51.27 IC4.14
  Bottom 0.254: v103.5,48.73 113.66,48.73 116.2,51.27 116.2,56.35 SV4.5
N$23
  Top 0.254: SV4.7 118.74,56.35 118.74,50 104.77,50 103.5,51.27 IC4.15
N$24
  Top 0.254: IC4.1 121.28,60.16 121.28,57.62 SV4.9
N$25  (via drill 0.61)
  Top 0.254: v19.68,52.54 19.68,46.19 18.41,44.92 IC8.9
  Bottom 0.254: v19.68,52.54 5.71,52.54 U$1.14
N$26
  Bottom 0.254: U$1.13 5.71,53.81 19.68,53.81 20.95,52.54 IC8.7
N$27  (via drill 0.61)
  Top 0.254: v28.57,22.06 32.38,22.06 32.38,16.98 34.92,14.44 34.92,9.36 38.73,9.36 38.73,53.81 40,55.08 40,70.32 33.65,76.67 IC14.1
  Bottom 0.254: v28.57,22.06 5.71,22.06 U$1.26 | IC14.4 26.03,81.75 27.3,83.02 32.38,83.02 33.65,81.75 IC14.1
N$28
  Bottom 0.254: SV4.11 123.82,56.35 123.82,60.16 121.28,62.7 104.77,62.7 103.5,61.43 IC4.2
N$29
  Bottom 0.254: SV4.13 126.36,56.35 126.36,60.16 122.55,63.97 103.5,63.97 100.96,61.43 IC4.3
N$30
  Bottom 0.254: SV4.15 128.9,56.35 128.9,60.16 123.82,65.24 102.23,65.24 98.42,61.43 IC4.4
N$32  (via drill 0.61)
  Top 0.254: IC5.20 v60.32,36.03
  Bottom 0.254: v60.32,36.03 61.59,37.3 92.07,37.3 93.34,38.57 IC11.6
N$33
  Bottom 0.254: SV6.1 98.42,36.03 95.88,33.49 IC11.12
N$34
  Bottom 0.254: SV6.3 116.2,37.3 118.74,37.3 118.74,30.95 116.2,28.41 100.96,28.41 98.42,30.95 IC11.13
N$35
  Bottom 0.254: SV6.5 116.2,36.03 116.2,30.95 114.93,29.68 102.23,29.68 100.96,30.95 IC11.14
N$36
  Top 0.254: SV6.7 120.01,37.3 113.66,37.3 113.66,29.68 104.77,29.68 103.5,30.95 IC11.15
N$37
  Top 0.254: IC11.1 121.28,39.84 121.28,37.3 SV6.9
N$38
  Bottom 0.254: SV6.11 123.82,36.03 123.82,39.84 121.28,42.38 104.77,42.38 103.5,41.11 IC11.2
N$39
  Bottom 0.254: SV6.13 126.36,36.03 126.36,39.84 122.55,43.65 103.5,43.65 100.96,41.11 IC11.3
N$40
  Bottom 0.254: SV6.15 128.9,36.03 128.9,39.84 123.82,44.92 102.23,44.92 98.42,41.11 IC11.4
N$41
  Bottom 0.254: SV8.1 98.42,76.67 95.88,74.13 IC12.12
N$42
  Bottom 0.254: SV8.3 113.66,76.67 113.66,71.59 112.39,70.32 99.69,70.32 98.42,71.59 IC12.13
N$43
  Top 0.254: SV8.5 118.74,76.67 118.74,70.32 102.23,70.32 100.96,71.59 IC12.14
N$44
  Top 0.254: SV8.7 118.74,77.94 118.74,80.48 109.85,80.48 103.5,74.13 IC12.15
N$45
  Bottom 0.254: SV8.9 121.28,77.94 107.31,77.94 106.04,79.21 IC12.1
N$46
  Bottom 0.254: SV8.11 123.82,76.67 123.82,80.48 121.28,83.02 104.77,83.02 103.5,81.75 IC12.2
N$47
  Bottom 0.254: SV8.13 126.36,76.67 126.36,80.48 122.55,84.29 103.5,84.29 100.96,81.75 IC12.3
N$48
  Bottom 0.254: SV8.15 128.9,76.67 128.9,80.48 123.82,85.56 102.23,85.56 98.42,81.75 IC12.4
N$49
  Bottom 0.254: IC13.20 60.32,72.86 84.45,72.86 86.99,70.32 94.61,70.32 94.61,79.21 93.34,79.21 IC12.6
N$50  (via drill 0.61)
  Top 0.254: v8.25,33.49 6.98,34.76 6.98,46.19 8.25,47.46 v8.25,74.13
  Bottom 0.254: v8.25,33.49 18.41,23.33 24.76,23.33 24.76,29.68 32.38,29.68 33.65,28.41 IC9.15 | v8.25,74.13 17.14,83.02 22.22,83.02 23.49,81.75 IC14.5
N$52  (via drill 0.61)
  Top 0.254: IC4.7 90.8,56.35 89.53,55.08 89.53,29.68 90.8,28.41 IC2.7 90.8,16.98 89.53,15.71 89.53,9.36 86.99,9.36 84.45,11.9 84.45,72.86 v81.91,75.4 | v29.84,75.4 29.84,77.94 28.57,79.21 IC14.3
  Bottom 0.254: v81.91,75.4 v29.84,75.4
N$53  (via drill 0.61)
  Top 0.254: v86.99,42.38 85.72,43.65 85.72,81.75 86.99,83.02 90.8,83.02 IC12.7
  Bottom 0.254: IC14.6 20.95,79.21 22.22,77.94 89.53,77.94 90.8,79.21 IC12.7 | v86.99,42.38 89.53,42.38 90.8,41.11 IC11.7
RD  (via drill 0.61)
  Top 0.254: IC1.22 65.4,9.36 64.13,10.63 64.13,25.87 65.4,27.14 IC5.22 65.4,36.03 64.13,37.3 64.13,46.19 65.4,47.46 IC3.22 65.4,60.16 64.13,61.43 64.13,71.59 | v24.76,76.67 24.76,55.08 23.49,53.81 IC8.6 | 64.13,71.59 v64.13,76.67 | 64.13,71.59 65.4,70.32 IC13.22
  Bottom 0.254: v64.13,76.67 v24.76,76.67
VCC  (via drill 0.61)
  Top 0.254: IC6.6 23.49,20.79 22.22,22.06 22.22,30.95 23.49,32.22 IC9.6 | IC6.16 36.19,13.17 37.46,14.44 37.46,24.6 36.19,25.87 IC9.16 36.19,28.41 34.92,29.68 34.92,37.3 | v29.84,85.56 32.38,83.02 32.38,76.67 33.65,75.4 IC14.14 33.65,71.59 36.19,69.05 IC7.1 36.19,63.97 37.46,62.7 37.46,55.08 36.19,53.81 IC8.1 36.19,47.46 34.92,46.19 34.92,37.3 | v33.65,37.3 34.92,37.3 | 79.37,25.87 79.37,10.63 80.64,9.36 IC1.28 | 79.37,25.87 80.64,27.14 IC5.28 | 79.37,25.87 79.37,46.19 80.64,47.46 IC3.28 80.64,50 81.91,51.27 81.91,66.51 80.64,67.78 IC13.28 80.64,76.67 v78.1,79.21 | SV2.6 SV2.8 SV2.10 123.82,18.25 | 123.82,18.25 SV2.12 SV2.14 SV2.16 | IC2.16 106.04,13.17 111.12,18.25 SV2.2 SV2.4 | 123.82,38.57 SV6.12 SV6.14 SV6.16 128.9,39.84 128.9,58.89 | 123.82,38.57 SV6.10 | IC11.16 106.04,33.49 111.12,38.57 SV6.2 SV6.4 SV6.6 SV6.8 | 123.82,38.57 123.82,18.25 | 123.82,58.89 SV4.12 SV4.14 128.9,58.89 | 123.82,58.89 SV4.10 | SV4.16 128.9,58.89 | IC4.16 106.04,53.81 111.12,58.89 SV4.2 SV4.4 SV4.6 SV4.8 | SV8.8 SV8.10 123.82,79.21 | 123.82,79.21 SV8.12 SV8.14 SV8.16 | IC12.16 106.04,74.13 111.12,79.21 SV8.2 SV8.4 SV8.6 | 123.82,58.89 123.82,79.21
  Bottom 0.254: U$1.1 5.71,85.56 v29.84,85.56 38.73,85.56 45.08,79.21 v78.1,79.21 | v33.65,37.3 24.76,37.3 23.49,36.03 IC9.6 | SV2.6 SV2.4 | SV6.10 SV6.8 | SV4.10 SV4.8 | SV8.8 SV8.6 | SV4.16 130.17,60.16 122.55,67.78 80.64,67.78 IC13.28
WR  (via drill 0.61)
  Top 0.254: IC1.27 78.1,9.36 76.83,10.63 76.83,25.87 78.1,27.14 IC5.27 | v13.33,39.84 13.33,79.21 20.95,86.83 38.73,86.83 v38.73,72.86 | v47.62,71.59 53.97,77.94 53.97,86.83 97.15,86.83 v97.15,25.87
  Bottom 0.254: v13.33,39.84 19.68,39.84 20.95,41.11 IC8.10 | v38.73,72.86 40,71.59 v47.62,71.59 | v97.15,25.87 93.34,22.06 86.99,22.06 78.1,13.17 IC1.27